# EasyEDA Pro project stopwatch.eprj, schematic Schematic1

## Sheets
1 mcu: Board Name: Board1; Create Date: 2025-03-25; Page Name: mcu; Project Name: stopwatch; Schematic Name: Schematic1; Update Date: 2025-05-22; Company: 嘉立创EDA; Page Size: A4; Version: V1.0
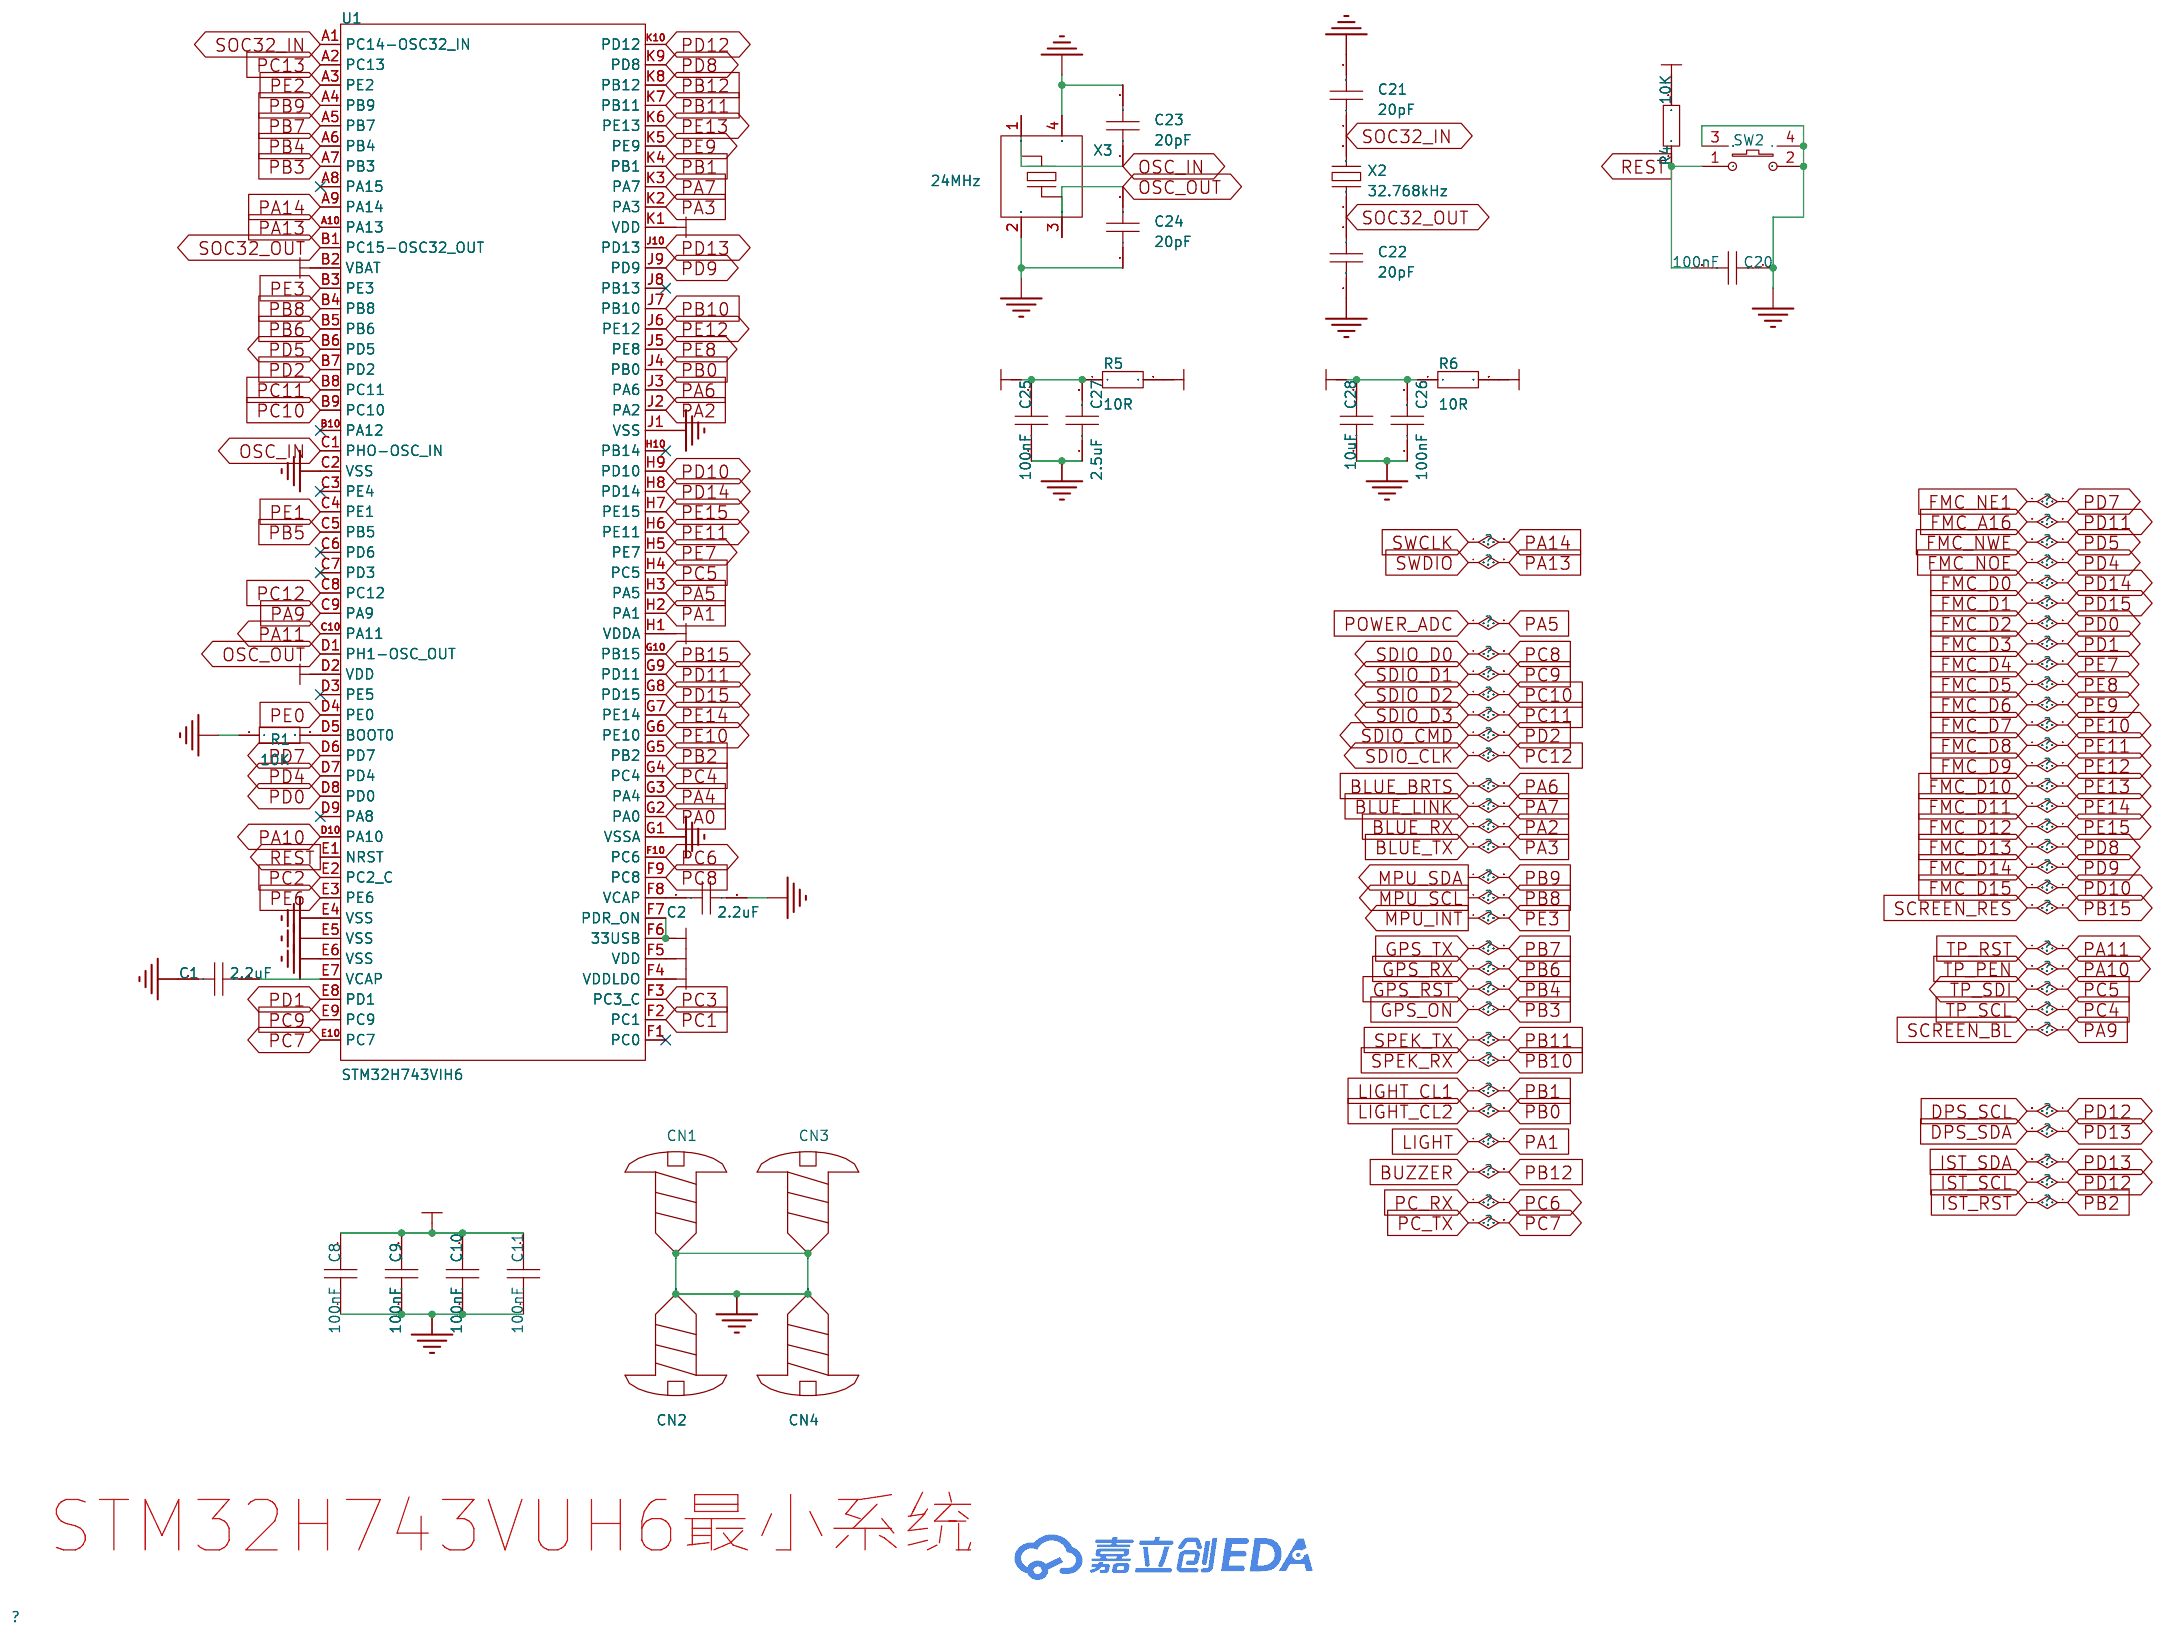
[diagram p0: mcu]
2 PERIPHERAL: Page Name: PERIPHERAL; Update Date: 2025-07-08; Page Size: A3
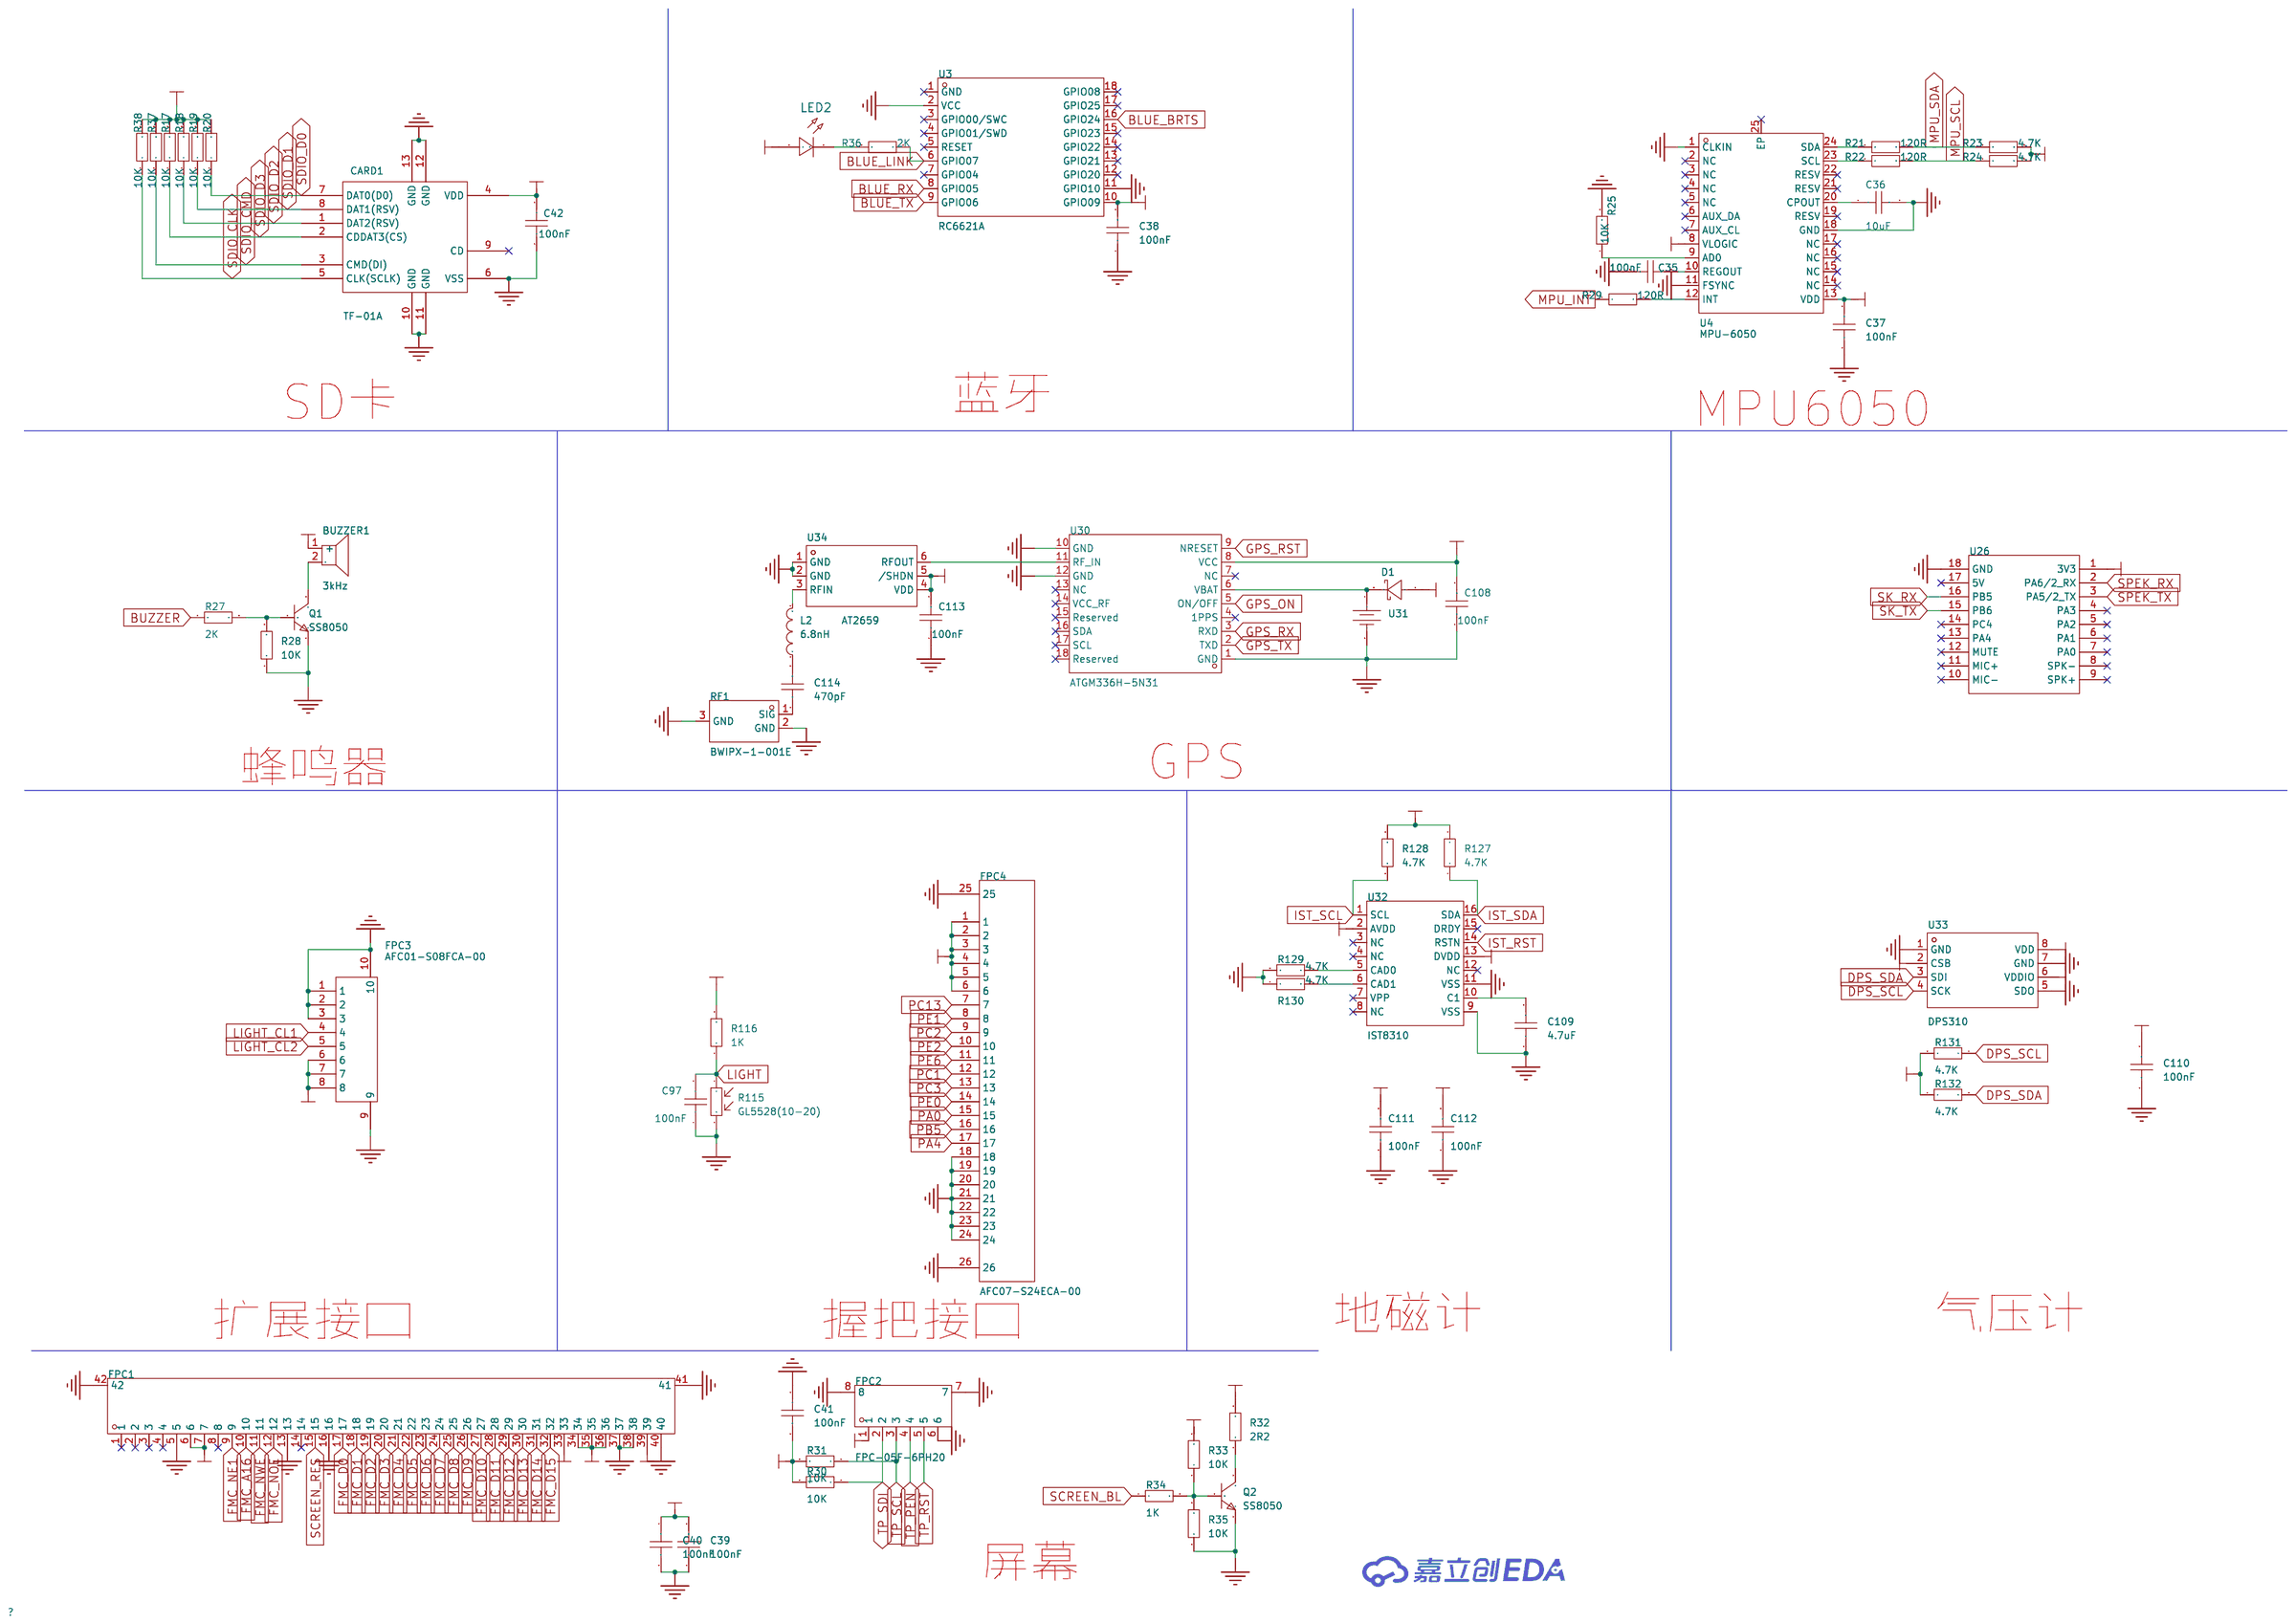
[diagram p1: PERIPHERAL]
3 power: Page Name: power; Update Date: 2025-07-08
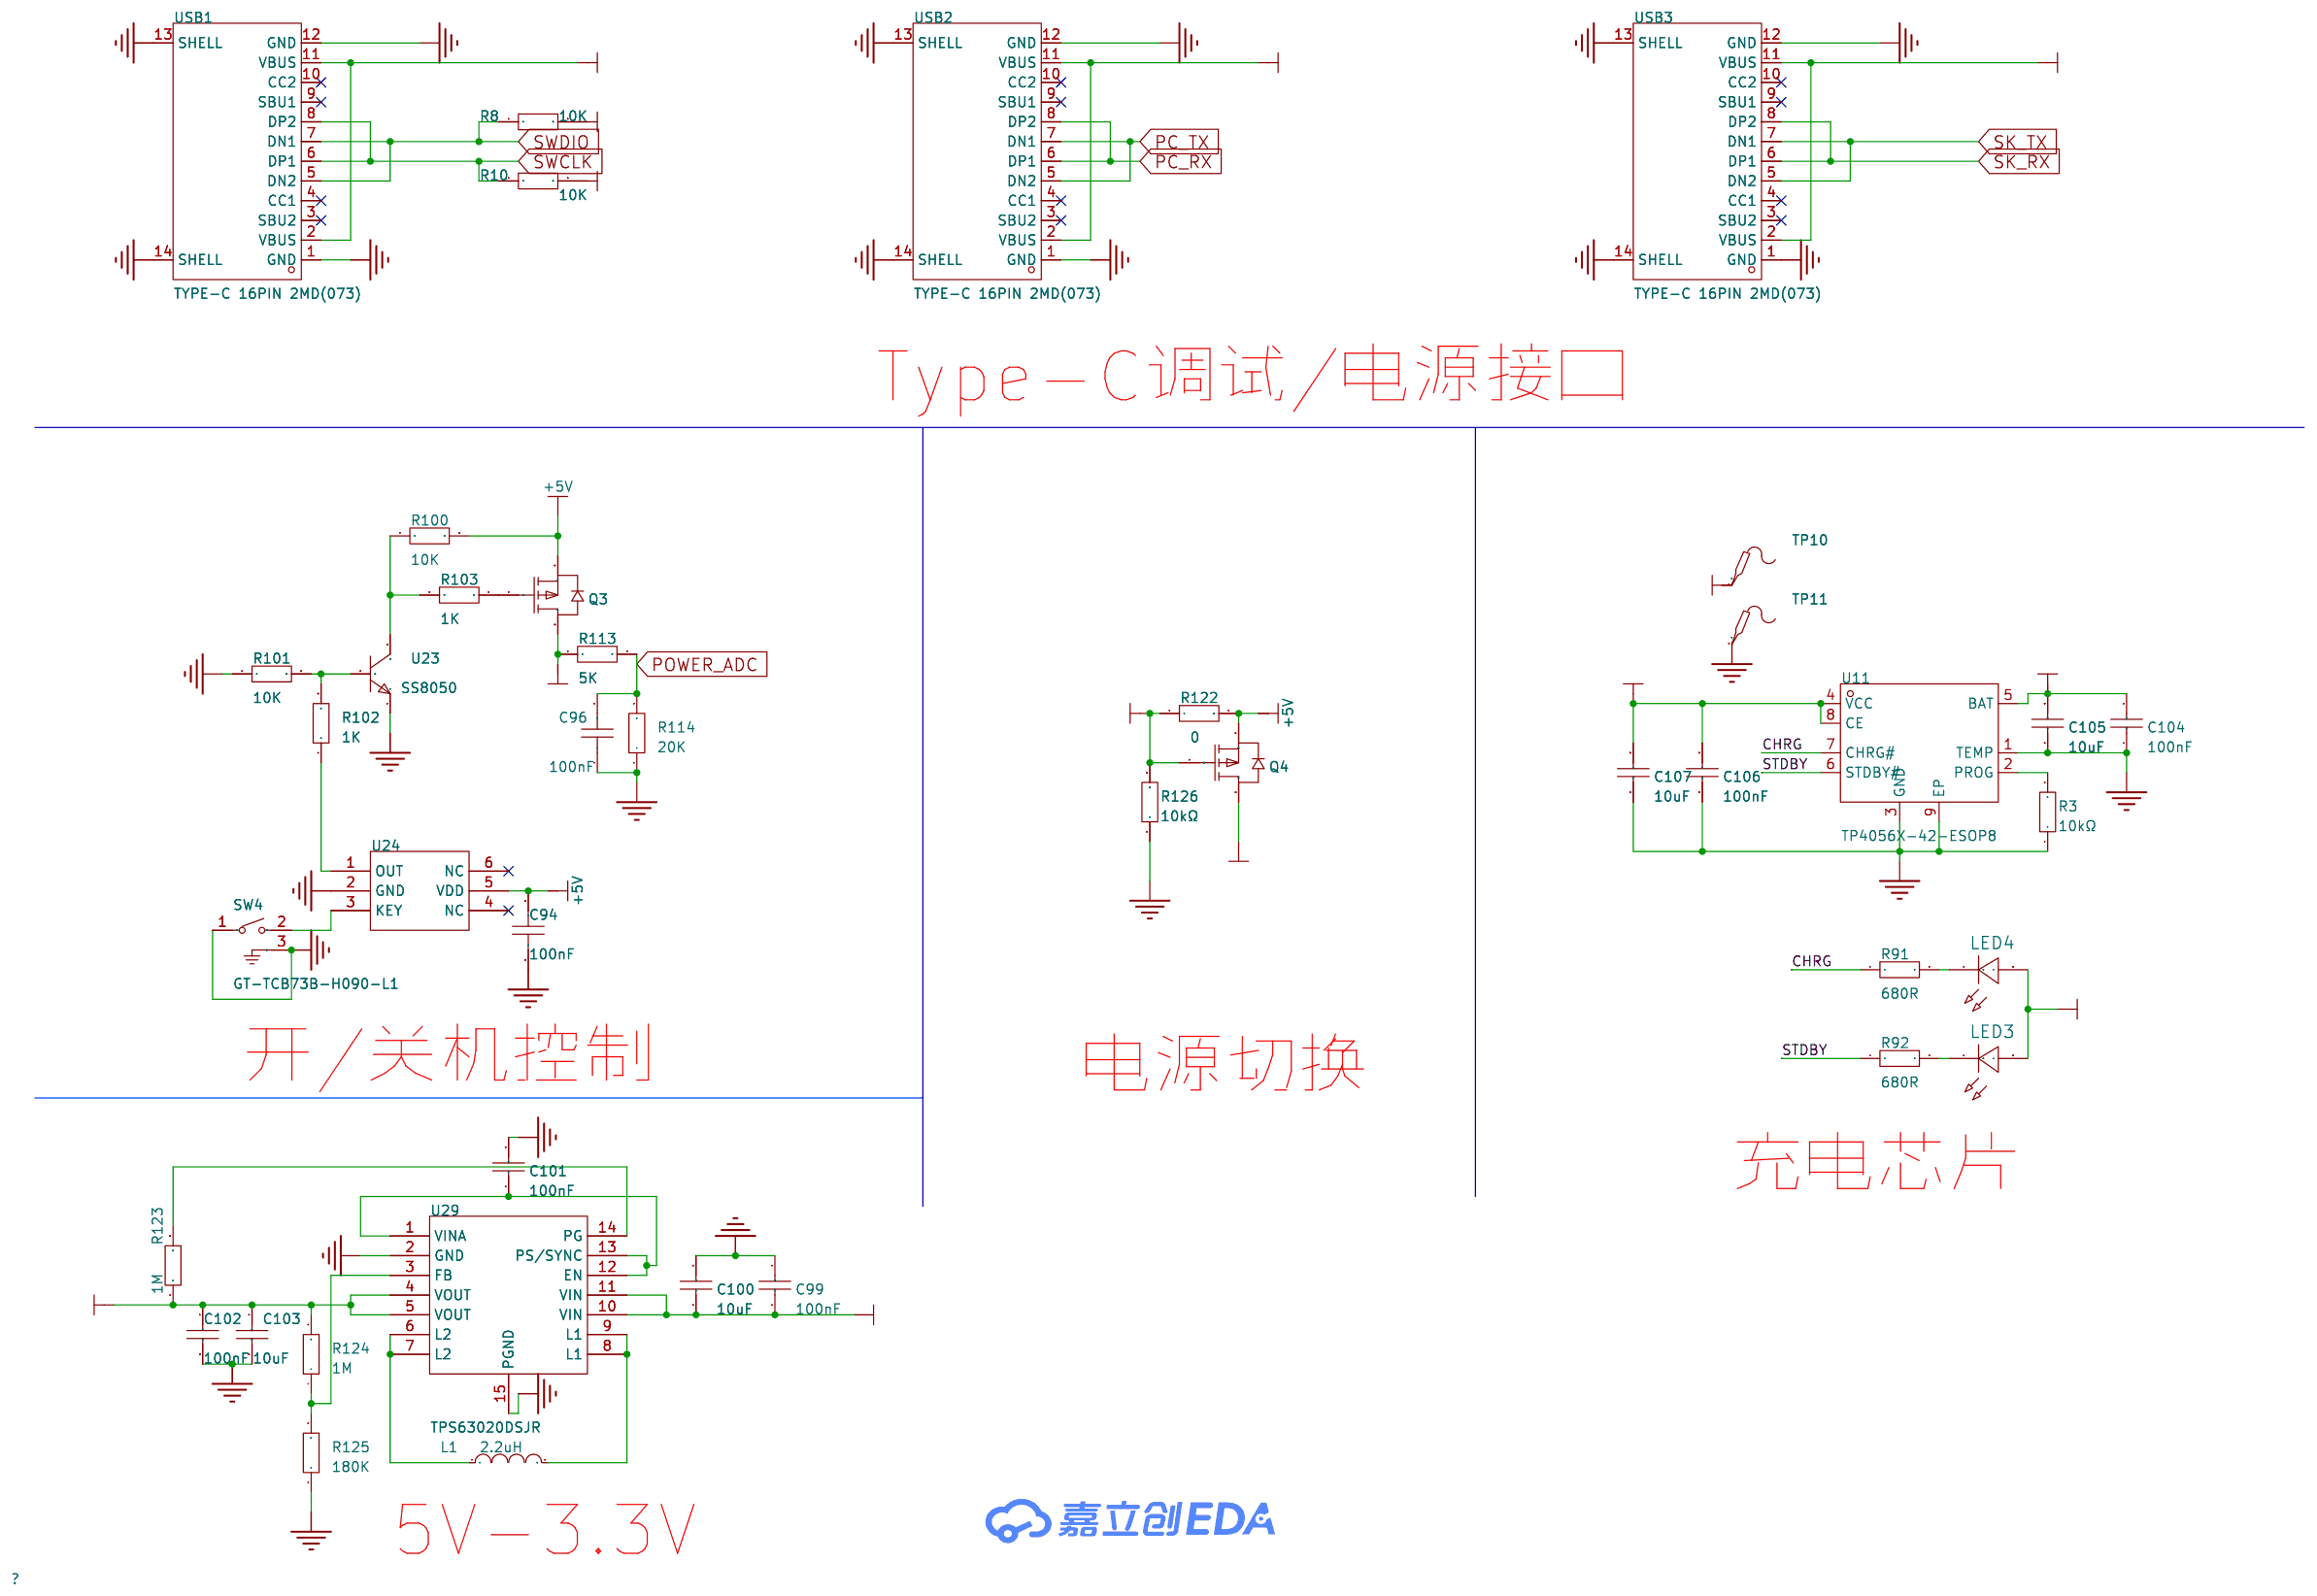
[diagram p2: power]

## Parts
sheet mcu
C1  2.2uF  [C0402]
C2  2.2uF  [C0402]
C8  100nF  [C0402]
C9  100nF  [C0402]
C10  100nF  [C0402]
C11  100nF  [C0402]
C20  100nF  [C0603]
C21  20pF  [C0402]
C22  20pF  [C0402]
C23  20pF  [C0402]
C24  20pF  [C0402]
C25  100nF  [C0402]
C26  100nF  [C0402]
C27  2.5uF  [C0402]
C28  10uF  [C0402]
CN1  SMTSOM330BTR  [M3-TH_BD6.0-D4.3]
CN2  SMTSOM330BTR  [M3-TH_BD6.0-D4.3]
CN3  SMTSOM330BTR  [M3-TH_BD6.0-D4.3]
CN4  SMTSOM330BTR  [M3-TH_BD6.0-D4.3]
R1  10K  [R0402]
R4  10K  [R0603]
R5  10R  [R0402]
R6  10R  [R0402]
SW2  TS24CA 250gf 013  [SW-SMD_L4.7-W3.5-P3.35-EH]
U1  STM32H743VIH6  [BGA-100_L8.0-W8.0-P0.80-R10-C10-BL]
X2  32.768kHz  [OSC-SMD_L3.2-W1.5]
X3  24MHz  [CRYSTAL-SMD_4P-L2.0-W1.6-BL-A]
sheet PERIPHERAL
BUZZER1  3kHz  [BUZ-TH_BD9.6-P5.00-D0.7-FD]
C35  100nF  [C0603]
C36  10uF  [C0603]
C37  100nF  [C0603]
C38  100nF  [C0603]
C39  100nF  [C0603]
C40  100nF  [C0603]
C41  100nF  [C0603]
C42  100nF  [C0603]
C97  100nF  [C0603]
C108  100nF  [C0603]
C109  4.7uF  [C0603]
C110  100nF  [C0603]
C111  100nF  [C0603]
C112  100nF  [C0603]
C113  100nF  [C0603]
C114  470pF  [C0603]
CARD1  TF-01A  [TF-SMD_TF-01A]
D1  B5819WS  [SOD-323_L1.7-W1.3-LS2.5-FD]
FPC1  AFC07-S40ECA-00  [FPC-SMD_P0.50-40P_LCS-SJ-H2.0]
FPC2  FPC-05F-6PH20  [FPC-SMD_6P-P0.50_XUNPU_FPC-05F-6PH20]
FPC3  AFC01-S08FCA-00  [FPC-SMD_P0.50-8P_FGS-XJ-H2.0]
FPC4  AFC07-S24ECA-00  [FPC-SMD_AFC07-S24ECA-00]
L2  6.8nH  [L0603]
LED2  -  [LED_0603]
Q1  SS8050  [SOT-23-3_L2.9-W1.3-P1.90-LS2.4-BR]
Q2  SS8050  [SOT-23-3_L2.9-W1.3-P1.90-LS2.4-BR]
R17  10K  [R0603]
R18  10K  [R0603]
R19  10K  [R0603]
R20  10K  [R0603]
R21  120R  [R0603]
R22  120R  [R0603]
R23  4.7K  [R0603]
R24  4.7K  [R0603]
R25  10K  [R0603]
R27  2K  [R0603]
R28  10K  [R0603]
R29  120R  [R0603]
R30  10K  [R0603]
R31  10K  [R0603]
R32  2R2  [R0603]
R33  10K  [R0603]
R34  1K  [R0603]
R35  10K  [R0603]
R36  2K  [R0603]
R37  10K  [R0603]
R38  10K  [R0603]
R115  GL5528(10-20)  [RES-TH_L5.1-W4.3-P3.40-D0.5]
R116  1K  [R0603]
R127  4.7K  [R0603]
R128  4.7K  [R0603]
R129  4.7K  [R0603]
R130  4.7K  [R0603]
R131  4.7K  [R0603]
R132  4.7K  [R0603]
RF1  BWIPX-1-001E  [IPEX-SMD_BWIPX-1-001E]
U3  RC6621A  [BULETM-SMD_18P-L15.2-W11.2-P1.27]
U4  MPU-6050  [QFN-24_L4.0-W4.0-P0.50-BL-EP2.7]
U26  -  [ASRPRO_CORE]
U30  ATGM336H-5N31  [GPSM-SMD_ATGM336H-TR]
U31  MS621FE-FL11E  [BAT-SMD_FL11E]
U32  IST8310  [LGA-16_L3.0-W3.0-P0.50-BL_SQ]
U33  DPS310  [LGA-8_DPS310XTSA1]
U34  AT2659  [DFN-6_L1.6-W1.0-P0.55-BL]
sheet power
C94  100nF  [C0603]
C96  100nF  [C0603]
C99  100nF  [C0603]
C100  10uF  [C0603]
C101  100nF  [C0603]
C102  100nF  [C0603]
C103  10uF  [C0603]
C104  100nF  [C0603]
C105  10uF  [C0603]
C106  100nF  [C0603]
C107  10uF  [C0603]
L1  2.2uH  [IND-SMD_L4.4-W4.2]
LED3  -  [LED_0603]
LED4  -  [LED_0603]
Q3  AO3401A  [SOT-23_L2.9-W1.3-P1.90-LS2.4-BR]
Q4  AO3401A  [SOT-23_L2.9-W1.3-P1.90-LS2.4-BR]
R3  10kΩ  [R0603]
R8  10K  [R0603]
R10  10K  [R0603]
R91  680R  [R0603]
R92  680R  [R0603]
R100  10K  [R0603]
R101  10K  [R0603]
R102  1K  [R0603]
R103  1K  [R0603]
R113  5K  [R0603]
R114  20K  [R0603]
R122  0  [R0603]
R123  1M  [R0603]
R124  1M  [R0603]
R125  180K  [R0603]
R126  10kΩ  [R0603]
SW4  GT-TCB73B-H090-L1  [SW-TH_G-SWITCH_GT-TCB73B-H090-L1]
TP10  -  [Test-Point-0.5mm]
TP11  -  [Test-Point-0.5mm]
U11  TP4056X-42-ESOP8  [SOP-8_L4.9-W3.9-P1.27-LS6.0-TL-EP]
U23  SS8050  [SOT-23-3_L2.9-W1.3-P1.90-LS2.4-BR]
U24  -  [SOT-23-6_L2.9-W1.6-P0.95-LS2.7-BR]
U29  TPS63020DSJR  [VSON-14_L4.0-W3.0-P0.50-BL-EP_TI_DSJ]
USB1  TYPE-C 16PIN 2MD(073)  [USB-C-SMD_TYPE-C-6PIN-2MD-073]
USB2  TYPE-C 16PIN 2MD(073)  [USB-C-SMD_TYPE-C-6PIN-2MD-073]
USB3  TYPE-C 16PIN 2MD(073)  [USB-C-SMD_TYPE-C-6PIN-2MD-073]

## Library data of the parts
C1 C2 C8-C11 C21-C28 = CAP_0402: Supplier Footprint: 0402
C20 C35-C42 C94 C96 C97 C108-C114 = CAP_0603: Supplier Footprint: 0603
CN1-CN4 = SMTSOM330BTR: LCSC Part Name: YIYUAN(怡远) 电路板表贴圆螺母柱PCB贴片连接器 M3X3 铜镀锡; Supplier Part: C5221843; Manufacturer: YIYUAN(怡远); Supplier Footprint: SMD; JLCPCB Part Class: 扩展库; Datasheet: https://atta.szlcsc.com/upload/public/pdf/source/20230202/A42D22DA7D93D728E13784C4003E4077.pdf; Supplier: LCSC; specifications: M3; surface treatment: 镀锡; material quality: 铜
R1 R5 R6 = Res_0402: Supplier Footprint: 0402
R4 R8 R10 R17-R25 R27-R38 R91 R92 R100-R103 R113 R114 R116 R122-R125 R127-R132 = Res_0603: Supplier Footprint: 0603
SW2 = TS24CA 250gf 013: 电路结构:单刀单掷;按钮形状:矩形按钮;作用力:250gf;安装方式:卧贴;开关长度:4.55mm;开关宽度:1.8mm;开关高度:3.5mm;带支架:不带;触点电流:50mA;额定电压(AC):-;额定电压(DC):12V;额定功率:0.6W;绝缘电阻:100MΩ;带灯:无;机械寿命:3万次;; LCSC Part Name: 2*4*3.5mm半包小贝贝TS-018小侧按键m165蓝牙耳机开关 250gf; Supplier Part: C5373430; Manufacturer: SHOU HAN(首韩); Supplier Footprint: SMD; JLCPCB Part Class: 扩展库; Datasheet: https://atta.szlcsc.com/upload/public/pdf/source/20230321/913029B0FB0CD391AF5EFD51697D8EC4.pdf; Supplier: LCSC; Circuit: 单刀单掷; Actuator Style: 矩形按钮; Operating Force: 250gf; Mounting Style: 卧贴; Switch Length: 4.55mm; Switch Width: 1.8mm; Switch Height: 3.5mm; Strike Gundam: 不带; Contact Current: 50mA; Voltage Rating (DC): 12V; Power Rating: 0.6W; Insulation Resistance: 100MΩ; Actuator/Cap Color: 黑色; With Lamp: 无; Mechanical Life: 3万次; Operating Temperature: -40℃~+85℃
U1 = STM32H743VIH6: LCSC Part Name: 带DSP和DP-FPU的高性能ARM Cortex-M7 MCU，具有2 MB Flash、1 MB RAM、480 MHz CPU、ART加速器、一级缓存、外部存储器接口和大量外设; Supplier Part: C964146; Manufacturer: ST(意法半导体); Supplier Footprint: TFBGA-100; JLCPCB Part Class: Extended Part; Datasheet: https://atta.szlcsc.com/upload/public/pdf/source/20220307/46489B78091107FB73FE6602EFA9948C.pdf; Supplier: LCSC
X2 = X321532768KGD2SI: 晶振类型:贴片晶振;频率:32.768kHz;常温频差:±20ppm;外接负载电容:12.5pF;频率稳定度(全温):-;; LCSC Part Name: 32.768kHz ±20ppm 12.5pF; Supplier Part: C620155; Manufacturer: YXC(扬兴晶振); Supplier Footprint: SMD3215-2P; JLCPCB Part Class: 扩展库; Datasheet: https://atta.szlcsc.com/upload/public/pdf/source/20240329/3A7650FD985DD0DE85694D3785AB4916.pdf; Supplier: LCSC; Crystal Type: 贴片晶振; Normal temperature Frequency Tolerance: ±20ppm; External load capacitor: 12.5pF; Operating Temperature: -40℃~+85℃
X3 = XL7EL89CKI-111YLC-24M: LCSC Part Name: 24MHz ±10ppm 8pF; Supplier Part: C2965580; Manufacturer: YXC(扬兴晶振); Supplier Footprint: SMD2016-4P; JLCPCB Part Class: 扩展库; Datasheet: https://atta.szlcsc.com/upload/public/pdf/source/20240329/C26C9A15A73CBCFBF373B30A8E126750.pdf; Supplier: LCSC; Type: 贴片晶振; Normal temperature Frequency Tolerance: ±10ppm; Load Capacitance: 8pF; Frequency Stability: ±20ppm; Operating Temperature: -40℃~+85℃
BUZZER1 = HNB09A05: Supplier Part: C96493; Manufacturer: 华能; Supplier Footprint: 插件,D=9mm; JLCPCB Part Class: Extended Part; Datasheet: https://atta.szlcsc.com/upload/public/pdf/source/20241128/E20AB0BE5F95571B8A04E10305734657.pdf; Supplier: LCSC; Driver Circuitry: 有源(内含驱动线路); Technology: 电磁式; Voltage - Supply: 4V~8V; Sound Pressure Level(SPL): 85dB; Diameter(φD): 9mm; Height: 5.7mm
CARD1 = TF-01A_C91145: 卡连接方式:自弹式;卡类型:MicroSD卡(TF卡);连接器类型:卡座;本体最大高度:1.85mm;工作温度范围:-;; LCSC Part Name: 自弹式 MicroSD卡(TF卡) 卡座; Supplier Part: C91145; Manufacturer: 韩国韩荣; Supplier Footprint: SMD; JLCPCB Part Class: 扩展库; Datasheet: https://atta.szlcsc.com/upload/public/pdf/source/20190322/C91145_63CBD6FB4639A3A3EC6A9721F18AE0FB.pdf; Supplier: LCSC; Card Connection Mode: 自弹式; Card Type: MicroSD卡(TF卡); Connector Type: 卡座; Supplementary Features: 带定位柱; Maximum Body Height: 1.85mm
D1 = B5819WS_C7420331: LCSC Part Name: 电压:40V 电流:1A; Supplier Part: C7420331; Manufacturer: 宏迦橙; Supplier Footprint: SOD-323; JLCPCB Part Class: 扩展库; Datasheet: https://atta.szlcsc.com/upload/public/pdf/source/20230828/03CA0F4F90DAE368A7153B7B5E4D0651.pdf; Supplier: LCSC; Diode Configuration: 独立式; Forward Voltage (Vf@If): 600mV@1.0A; Reverse Voltage (Vr): 40V; Rectified Current: 1A; Reverse Leakage Current (Ir): 1mA@40V
FPC1 = AFC07-S40ECA-00: 锁定特性:抽屉式;触点类型:上接;触点数量:40P;间距:0.5mm;安装类型:卧贴;; LCSC Part Name: 间距:0.5mm P数:40P 抽屉式 上接; Supplier Part: C262648; Manufacturer: JS(钜硕电子); Supplier Footprint: SMD,P=0.5mm,卧贴; JLCPCB Part Class: 扩展库; Datasheet: https://atta.szlcsc.com/upload/public/pdf/source/20190726/C11082_A2E7B12387019CE4314BB5199EE0FDF4.pdf; Supplier: LCSC; Locking Feature: 抽屉式; Contact Type: 上接; Number of Contacts: 40P; Pitch: 0.5mm; Mounting Type: 卧贴; FFC, FCB Thickness: 0.3mm; Height Above Board: 2mm
FPC2 = FPC-05F-6PH20: 锁定特性:翻盖式;触点类型:下接;触点数量:6P;间距:0.5mm;安装类型:卧贴;工作温度范围:-25℃~+85℃;; LCSC Part Name: 间距:0.5mm P数:6P 翻盖式 下接; Supplier Part: C2856796; Manufacturer: XUNPU(讯普); Supplier Footprint: SMD,P=0.5mm,卧贴; JLCPCB Part Class: 扩展库; Datasheet: https://atta.szlcsc.com/upload/public/pdf/source/20210922/16B003FB53336DDF6538142CC465AC4D.pdf; Supplier: LCSC; Locking Feature: 翻盖式; Contact Type: 下接; Number of Contacts: 6P; Pitch: 0.5mm; Mounting Type: 卧贴; FFC, FCB Thickness: 0.3mm; Height Above Board: 2mm; Operating Temperature Range: -25℃~+85℃
FPC3 = AFC01-S08FCA-00: 锁定特性:翻盖式;触点类型:下接;触点数量:8P;间距:0.5mm;安装类型:卧贴;; LCSC Part Name: 间距:0.5mm P数:8P 翻盖式 下接; Supplier Part: C262657; Manufacturer: JS(钜硕电子); Supplier Footprint: SMD,P=0.5mm,卧贴; JLCPCB Part Class: 扩展库; Datasheet: https://atta.szlcsc.com/upload/public/pdf/source/20190816/C413942_2A72D1AC756EAE17EEDF756A339D4500.pdf; Supplier: LCSC; Locking Feature: 翻盖式; Contact Type: 下接; Number of Contacts: 8P; Pitch: 0.5mm; Mounting Type: 卧贴; FFC, FCB Thickness: 0.3mm; Height Above Board: 2mm
FPC4 = AFC07-S24ECA-00: LCSC Part Name: 间距:0.5mm P数:24P 抽屉式 上接; Supplier Part: C262643; Manufacturer: JS(钜硕电子); Supplier Footprint: SMD,P=0.5mm,卧贴; JLCPCB Part Class: 扩展库; Datasheet: https://atta.szlcsc.com/upload/public/pdf/source/20190726/C11082_A2E7B12387019CE4314BB5199EE0FDF4.pdf; Supplier: LCSC; Locking Feature: 抽屉式; Contact Type: 上接; Number of Contacts: 24P; Pitch: 0.5mm; Mounting Type: 卧贴; FFC, FCB Thickness: 0.3mm; Height Above Board: 2mm
L2 = LQW18AN6N8C00D: Supplier Part: C86136; Manufacturer: muRata(村田); Supplier Footprint: 0603; JLCPCB Part Class: 扩展库; Datasheet: https://atta.szlcsc.com/upload/public/pdf/source/20180326/C86136_7D4C2B2C0A8359F5C7679A70DBFFC85D.pdf; Supplier: LCSC; Rated Current: 750mA; DC Resistance (DCR): 82mΩ
LED2-LED4 = LED_0603-R: Supplier Footprint: 0603
Q1 Q2 = SS8050_C916392: 晶体管类型:NPN;集电极电流(Ic):1.5A;集射极击穿电压(Vceo):25V;功率(Pd):300mW;直流电流增益(hFE@Ic,Vce):-;; LCSC Part Name: NPN 电流:1.5A 耐压:25V; Supplier Part: C916392; Manufacturer: JSMSEMI(杰盛微); Supplier Footprint: SOT-23; JLCPCB Part Class: 扩展库; Datasheet: https://atta.szlcsc.com/upload/public/pdf/source/20230807/CAABCAAF77D43CB838E37CFA5C9BFE5C.pdf; Supplier: LCSC; Transistor Type: NPN; Collector Current (Ic): 1.5A; Collector-Emitter Breakdown Voltage (Vceo): 25V; Power Dissipation (Pd): 300mW; Collector Cut-Off Current (Icbo): 100nA; Collector-Emitter Saturation Voltage (VCE(sat)@Ic,Ib): 500mV@800mA,80mA; Operating Temperature: -55℃~+150℃
R115 = GL5528(10-20)_C10081: 暗电阻:1MΩ;亮电阻 @ 10Lux:10kΩ~20kΩ;光谱峰值(波长):540nm;; LCSC Part Name: 亮电阻:10kΩ~20kΩ 暗电阻:1MΩ; Supplier Part: C10081; Manufacturer: JCHL(晶创和立); Supplier Footprint: 插件,P=3.4mm; JLCPCB Part Class: 扩展库; Datasheet: https://atta.szlcsc.com/upload/public/pdf/source/20200417/C515010_C10502EF7F431E893A7F20DB83F527F0.pdf; Supplier: LCSC; Dark Resistance: 1MΩ; Illuminated Resistance @ 10Lux: 10kΩ~20kΩ; Applied Voltage: 150V; Spectral Peak: 540nm
RF1 = BWIPX-1-001E: 连接器类型:板端;接口类型:内针;端口数量:1;接口直径:-;接口长度/高度:-;频率-最大值:6GHz;射频系列:IPEX;阻抗:50Ω;样式:-;工作温度范围:-;; LCSC Part Name: IPEX 内针; Supplier Part: C496552; Manufacturer: BAT WIRELESS(蝙蝠无线); Supplier Footprint: SMD; JLCPCB Part Class: 扩展库; Datasheet: https://atta.szlcsc.com/upload/public/pdf/source/20201223/C496552_05E5A9956EAE1A8819C5051D085B1DED.pdf; Supplier: LCSC; Connector Type: 板端; Interface Type: 内针; Number of Ports: 1; Frequency-Max: 6GHz; RF Series: IPEX; Impedance: 50Ω
U3 = RC6621A: 核心芯片:HS6621A芯片;支持接口:UART;最大发射功率:6dBm;通讯距离:20m~100m;接收灵敏度:-94dBm;; LCSC Part Name: 蓝牙5.2 BLE透传模块; Supplier Part: C2886280; Manufacturer: RF Crazy(智汉); Supplier Footprint: SMD,11x15mm; JLCPCB Part Class: 扩展库; Datasheet: https://atta.szlcsc.com/upload/public/pdf/source/20230407/49E21971C810D795DE5D434EE457DEDA.pdf; Supplier: LCSC; Core  IC: HS6621A芯片; Support Interface: UART; Output Power  (Max): 6dBm; Operating Voltage: 2V~3.6V; Receive  Current: 3.8mA; Send  Current: 8mA; Communication Distance: 20m~100m; Sensitivity: -94dBm; Operating Temperature: -30℃~+85℃
U4 = MPU-6050: 传感器类型:加速度计陀螺仪;; Supplier Part: C24112; Manufacturer: TDK InvenSense(应美盛); Supplier Footprint: QFN-24-EP(4x4); JLCPCB Part Class: 扩展库; Datasheet: https://atta.szlcsc.com/upload/public/pdf/source/20140425/1457707046159.pdf; Supplier: LCSC; Sensor Type: 加速度计陀螺仪; Operating Temperature: -40℃~+85℃
U26 = ASRPRO_CORE
U30 = ATGM336H-5N31: 卫星定位模块 GPS+BDS; LCSC Part Name: BDS/GNSS 全星座定位导航模块; Supplier Part: C90770; Manufacturer: 杭州中科微; Supplier Footprint: SMD,9.7x10.1mm; JLCPCB Part Class: 扩展库; Datasheet: https://atta.szlcsc.com/upload/public/pdf/source/20161226/1482720799860.pdf; Supplier: LCSC
U31 = MS621FE-FL11E: FL11E 3.3V可充电纽扣电池 5.5mAH; LCSC Part Name: Seiko/精工，可充电纽扣电池，3V，MS621FE-FL11E，1个; Supplier Part: C80909; Manufacturer: Seiko(精工); JLCPCB Part Class: 扩展库; Datasheet: https://atta.szlcsc.com/upload/public/pdf/source/20230719/88F2811CC6B30DD05F1C5A5953BF9E77.pdf; Supplier: LCSC; voltage: 3 V; capacity: 5.5mAh; chemical composition: 锂离子; temperature range: -20-60°C; type: 纽扣; characteristic: 可充电; Packaging quantity: 1; Battery capacity: -；-；-
U32 = IST8310_C2683055: Supplier Part: C2683055; Manufacturer: iSentek(爱盛科技); Supplier Footprint: LGA-16(3x3); JLCPCB Part Class: 扩展库; Datasheet: https://atta.szlcsc.com/upload/public/pdf/source/20250224/70FB1E25A3B1BEF4BDD1315496E152E4.pdf; Supplier: LCSC
U33 = DPS310: LCSC Part Name: DPS310 停产; Supplier Part: C130156; Manufacturer: Infineon(英飞凌); Supplier Footprint: LGA-8(2x2.5); JLCPCB Part Class: 扩展库; Datasheet: https://atta.szlcsc.com/upload/public/pdf/source/20170919/C130156_1505787189817976894.pdf; Supplier: LCSC
U34 = AT2659: LCSC Part Name: L1频段卫星导航射频前端低噪声放大器芯片; Supplier Part: C92450; Manufacturer: 杭州中科微; Supplier Footprint: DFN-6(1x1.6); JLCPCB Part Class: 扩展库; Datasheet: https://atta.szlcsc.com/upload/public/pdf/source/20170105/1483610792788.pdf; Supplier: LCSC; Supply Voltage: 1.4V~3.6V; Gain: 21.5dB; P1dB: -14dBm; Noise Figure: 0.8dB
C99 C101 C102 C104 C106 = CC0603KRX7R9BB104: 容值:100nF;精度:±10%;额定电压:50V;材质(温度系数):X7R;; LCSC Part Name: 100nF ±10% 50V; Supplier Part: C14663; Manufacturer: YAGEO(国巨); Supplier Footprint: 0603; JLCPCB Part Class: Basic Part; Datasheet: https://atta.szlcsc.com/upload/public/pdf/source/20180910/C282072_33301C7F631E79921B82A8DAC6BCC5B3.pdf; Supplier: LCSC; Tolerance: ±10%; Voltage Rated: 50V; Temperature Coefficient: X7R
C100 C103 C105 C107 = CL10A106MA8NRNC: 容值:10uF;精度:±20%;额定电压:25V;材质(温度系数):X5R;; LCSC Part Name: 10uF ±20% 25V; Supplier Part: C96446; Manufacturer: SAMSUNG(三星); Supplier Footprint: 0603; JLCPCB Part Class: 基础库; Datasheet: https://atta.szlcsc.com/upload/public/pdf/source/20170325/1490427913016.pdf; Supplier: LCSC; Tolerance: ±20%; Voltage Rated: 25V; Temperature Coefficient: X5R
L1 = FXL0420-4R7-M: 电感值:4.7uH;精度:±20%;额定电流:2.8A;饱和电流(Isat):3A;类型:一体成型电感;; LCSC Part Name: 4.7uH ±20% 3A; Supplier Part: C167208; Manufacturer: cjiang(长江微电); Supplier Footprint: SMD,4.2x4.4mm; JLCPCB Part Class: 扩展库; Datasheet: https://atta.szlcsc.com/upload/public/pdf/source/20240426/3189EA8206330E2108542F9E34E540E7.pdf; Supplier: LCSC; Tolerance: ±20%; Rated Current: 2.8A; Saturation Current (Isat): 3A; DC Resistance (DCR): 105mΩ; Type: 一体成型电感
Q3 Q4 = AO3401A_C15127: 类型:P沟道;漏源电压(Vdss):30V;连续漏极电流(Id):4A;功率(Pd):1.4W;导通电阻(RDS(on)@Vgs,Id):44mΩ@10V,4.3A;; LCSC Part Name: P沟道30V4A; Supplier Part: C15127; Manufacturer: AOS; Supplier Footprint: SOT-23-3L; JLCPCB Part Class: BasicPart; Datasheet: https://atta.szlcsc.com/upload/public/pdf/source/20160507/1462613609053.pdf; Supplier: LCSC; Type: P沟道; Drain Source Voltage (Vdss): 30V; Continuous Drain Current (Id): 4A; Power Dissipation (Pd): 1.4W; Drain Source On Resistance (RDS(on)@Vgs,Id): 44mΩ@10V,4.3A; Gate Threshold Voltage (Vgs(th)@Id): 1.3V@250uA
R3 R126 = 0603WAF1002T5E: 电阻类型:厚膜电阻;阻值:10kΩ;精度:±1%;功率:100mW;; LCSC Part Name: 厚膜电阻 10kΩ ±1% 100mW; Supplier Part: C25804; Manufacturer: UNI-ROYAL(厚声); Supplier Footprint: 0603; JLCPCB Part Class: 基础库; Datasheet: https://atta.szlcsc.com/upload/public/pdf/source/20200306/C422600_1E6D84923E4A46A82E41ADD87F860B5C.pdf; Supplier: LCSC; Type: 厚膜电阻; Tolerance: ±1%; Power(Watts): 100mW; Temperature Coefficient: ±100ppm/℃; Overload Voltage (Max): 75V; Operating Temperature Range: -55℃~+155℃
SW4 = GT-TCB73B-H090-L1: LCSC Part Name: 4.5*4.5*9mm 卧插 轻触开关; Supplier Part: C2890355; Manufacturer: G-Switch(品赞); Supplier Footprint: 插件; JLCPCB Part Class: 扩展库; Datasheet: https://atta.szlcsc.com/upload/public/pdf/source/20211129/A9DBC36F7854845B7C58D6A3B2089FE3.pdf; Supplier: LCSC; Circuit: 单刀单掷; Actuator Style: 圆形按钮; Operating Force: 2.5N; Mounting Style: 卧插; Switch Length: 4.5mm; Switch Width: 4.5mm; Switch Height: 9mm; Strike Gundam: 不带; Contact Current: 50mA; Voltage Rating (DC): 12V; Insulation Resistance: 100MΩ; Actuator/Cap Color: 黑色; With Lamp: 无; Pin Style: PC引脚; Mechanical Life: 10万次; Operating Temperature: -30℃~+85℃
TP10 TP11 = Test-Point: Test Point 测试点
U11 = TP4056X-42-ESOP8: Supplier Part: C2763448; Manufacturer: TOPPOWER(南京拓微); Supplier Footprint: SOP-8-EP-150mil; JLCPCB Part Class: 扩展库; Datasheet: https://atta.szlcsc.com/upload/public/pdf/source/20221111/3D7D53D5011BF4ED4C4D0D9BFDBB1404.pdf; Supplier: LCSC
U23 = SS8050_C7420370: 晶体管类型:NPN;集电极电流(Ic):1.5A;集射极击穿电压(Vceo):25V;功率(Pd):300mW;直流电流增益(hFE@Ic,Vce):120@100mA,1.0V;; LCSC Part Name: 耐压:25V 电流:1.5A NPN H档 200-350; Supplier Part: C7420370; Manufacturer: 宏迦橙; Supplier Footprint: SOT-23; JLCPCB Part Class: Extended Part; Datasheet: https://atta.szlcsc.com/upload/public/pdf/source/20231222/9C4050A7669EB24B3ACD0418218817FD.pdf; Supplier: LCSC; Transistor Type: NPN; Collector Current (Ic): 1.5A; Collector-Emitter Breakdown Voltage (Vceo): 25V; Power Dissipation (Pd): 300mW; DC Current Gain (hFE@Ic,Vce): 120@100mA,1.0V; Transition Frequency (fT): 100MHz; Collector Cut-Off Current (Icbo): 100nA; Collector-Emitter Saturation Voltage (VCE(sat)@Ic,Ib): 500mV@800mA,80mA; Operating Temperature: -55℃~+150℃
U24 = EC190708
U29 = TPS63020DSJR: 功能类型:升降压型;输出类型:可调;输入电压:1.8V~5.5V;输出电压:1.2V~5.5V;输出电流(最大值):3.5A;; Supplier Part: C15483; Manufacturer: TI(德州仪器); Supplier Footprint: VSON-14-EP(3x4); JLCPCB Part Class: 扩展库; Datasheet: https://www.ti.com/cn/lit/gpn/tps63020; Supplier: LCSC; Function: 升降压型; Output Type: 可调; Input Voltage: 1.8V~5.5V; Output Voltage: 1.2V~5.5V; Output Current (Max): 3.5A; Switching Frequency: 2.4MHz; Operating Temperature: -40℃~+85℃@(TA); Synchronous Rectification: 是; Number of Outputs: 1; Topology: 降压-升压式; Switch tube (built-in/external): 内置
USB1-USB3 = TYPE-C 16PIN 2MD(073): 连接器类型:Type-C;标准:USB 3.1;公母:母;安装方式:卧贴;触点数量:16P;端口数量:1;额定电流 - 电源:5A;工作温度范围:-25℃~+85℃;; LCSC Part Name: Type-C 母 卧贴; Supplier Part: C2765186; Manufacturer: SHOU HAN(首韩); Supplier Footprint: SMD; JLCPCB Part Class: 扩展库; Datasheet: https://atta.szlcsc.com/upload/public/pdf/source/20211123/39B17C16241EAC15C5E277BDA434118E.pdf; Supplier: LCSC; Connector Type: Type-C; Standard: USB 3.1; Gender: 母; Mounting Style: 卧贴; Number of Contacts: 16P; Number of Ports: 1; Current Rating - Power (Max): 5A; Operating Temperature Range: -25℃~+85℃; Rated Voltage (Max): 5V; Connect-Disconnect Life: 5千次; Core Colour: 黑色

## Nets
5V: C99.1 C100.1 D1.1(A) FPC3.6 FPC3.7 FPC3.8 Q3.3(D) R113.1 U29.10(VIN) U29.11(VIN)
+5V: C94.2 Q3.2(S) Q4.2(S) R100.2 R122.2 U24.5(VDD)
GND: C1.1 C2.2 C8.1 C9.1 C10.1 C11.1 C20.1 C21.2 C22.1 C23.2 C24.1 C25.1 C26.1 C27.1 C28.1 C35.1 C36.2 C37.1 C38.1 C39.1 C40.2 C41.1 C42.1 C94.1 C96.1 C97.1 C99.2 C100.2 C101.2 C102.2 C103.2 C104.1 C105.1 C106.1 C107.1 C108.1 C109.1 C110.1 C111.1 C112.1 C113.1 CARD1.6(VSS) CARD1.10(GND) CARD1.11(GND) CARD1.12(GND) CARD1.13(GND) CN1.1 CN2.1 CN3.1 CN4.1 FPC1.5 FPC1.13 FPC1.16 FPC1.37 FPC1.38 FPC1.40 FPC1.41 FPC1.42 FPC2.6 FPC2.7 FPC2.8 FPC3.1 FPC3.2 FPC3.3 FPC3.9 FPC3.10 FPC4.18 FPC4.19 FPC4.20 FPC4.21 FPC4.22 FPC4.23 FPC4.24 FPC4.25 FPC4.26 Q1.2(E) Q2.2(E) R1.1 R3.1 R25.2 R28.1 R35.1 R101.1 R114.1 R115.2 R125.1 R126.1 R129.2 R130.1 RF1.2(GND) RF1.3(GND) SW2.2 SW2.3 SW2.4 SW4.1 SW4.3 TP11.1 U1.C2(VSS) U1.E4(VSS) U1.E5(VSS) U1.E6(VSS) U1.G1(VSSA) U1.J1(VSS) U3.2(VCC) U3.11(GPIO10) U4.1(CLKIN) U4.11(FSYNC) U4.18(GND) U11.1(TEMP) U11.3(GND) U11.9(EP) U23.2(E) U24.2(GND) U26.18(GND) U29.2(GND) U29.15(PGND) U30.1(GND) U30.10(GND) U30.12(GND) U31.2(-) U32.9(VSS) U32.11(VSS) U33.1(GND) U33.5(SDO) U33.7(GND) U34.1(GND) U34.2(GND) USB1.1(GND) USB1.12(GND) USB1.13(SHELL) USB1.14(SHELL) USB2.1(GND) USB2.12(GND) USB2.13(SHELL) USB2.14(SHELL) USB3.1(GND) USB3.12(GND) USB3.13(SHELL) USB3.14(SHELL) X3.2(GND) X3.4(GND)
VBAT: C104.2 C105.2 Q4.3(D) TP10.1 U11.5(BAT)
VBUS: C106.2 C107.2 LED3.2(A) LED4.2(A) Q4.1(G) R122.1 R126.2 U11.4(VCC) U11.8(CE) USB1.2(VBUS) USB1.11(VBUS) USB2.2(VBUS) USB2.11(VBUS) USB3.2(VBUS) USB3.11(VBUS)
VCC3V3: BUZZER1.1(+) C8.2 C9.2 C10.2 C11.2 C37.2 C38.2 C39.2 C40.1 C41.2 C42.2 C102.1 C103.1 C108.2 C110.2 C111.2 C112.2 C113.2 CARD1.4(VDD) FPC1.6 FPC1.7 FPC1.33 FPC1.39 FPC2.1 FPC4.1 FPC4.2 FPC4.3 FPC4.4 FPC4.5 FPC4.6 LED2.2(A) R4.2 R6.2 R8.2 R10.2 R17.2 R18.2 R19.2 R20.2 R23.2 R24.2 R30.2 R31.2 R33.2 R37.2 R38.2 R116.2 R123.1 R124.2 R127.2 R128.1 R131.2 R132.1 U1.B2(VBAT) U1.D2(VDD) U1.F5(VDD) U1.F6(33USB) U1.F7(PDR_ON) U1.K1(VDD) U3.10(GPIO09) U4.8(VLOGIC) U4.13(VDD) U26.1(3V3) U29.4(VOUT) U29.5(VOUT) U30.8(VCC) U32.2(AVDD) U32.13(DVDD) U33.2(CSB) U33.6(VDDIO) U33.8(VDD) U34.4(VDD) U34.5(/SHDN)
VDDA: C26.2 C28.2 R5.2 R6.1 U1.H1(VDDA)
BLUE_BRTS: U1.J3(PA6) U3.16(GPIO24)
BLUE_LINK: R36.1 U1.K3(PA7) U3.6(GPIO07)
BLUE_RX: U1.J2(PA2) U3.8(GPIO05)
BLUE_TX: U1.K2(PA3) U3.9(GPIO06)
BUZZER: R27.1 U1.K8(PB12)
CHRG: R91.1 U11.7(CHRG#)
DPS_SCL: R128.2 R131.1 U1.K10(PD12) U32.1(SCL) U33.4(SCK)
DPS_SDA: R127.1 R132.2 U1.J10(PD13) U32.16(SDA) U33.3(SDI)
FMC_A16: FPC1.10 U1.G9(PD11)
FMC_D0: FPC1.17 U1.H8(PD14)
FMC_D1: FPC1.18 U1.G8(PD15)
FMC_D2: FPC1.19 U1.D8(PD0)
FMC_D3: FPC1.20 U1.E8(PD1)
FMC_D4: FPC1.21 U1.H5(PE7)
FMC_D5: FPC1.22 U1.J5(PE8)
FMC_D6: FPC1.23 U1.K5(PE9)
FMC_D7: FPC1.24 U1.G6(PE10)
FMC_D8: FPC1.25 U1.H6(PE11)
FMC_D9: FPC1.26 U1.J6(PE12)
FMC_D10: FPC1.27 U1.K6(PE13)
FMC_D11: FPC1.28 U1.G7(PE14)
FMC_D12: FPC1.29 U1.H7(PE15)
FMC_D13: FPC1.30 U1.K9(PD8)
FMC_D14: FPC1.31 U1.J9(PD9)
FMC_D15: FPC1.32 U1.H9(PD10)
FMC_NE1: FPC1.9 U1.D6(PD7)
FMC_NOE: FPC1.12 U1.D7(PD4)
FMC_NWE: FPC1.11 U1.B6(PD5)
GPS_ON: U1.A7(PB3) U30.5(ON/OFF)
GPS_RST: U1.A6(PB4) U30.9(NRESET)
GPS_RX: U1.B5(PB6) U30.3(RXD)
GPS_TX: U1.A5(PB7) U30.2(TXD)
IST_RST: U1.G5(PB2) U32.14(RSTN)
K: FPC1.34 FPC1.35 FPC1.36 R32.2
LIGHT: C97.2 R115.1 R116.1 U1.H2(PA1)
LIGHT_CL1: FPC3.4 U1.K4(PB1)
LIGHT_CL2: FPC3.5 U1.J4(PB0)
MPU_INT: R29.1 U1.B3(PE3)
MPU_SCL: R22.2 R24.1 U1.B4(PB8)
MPU_SDA: R21.2 R23.1 U1.A4(PB9)
OSC_IN: C23.1 U1.C1(PHO-OSC_IN) X3.1
OSC_OUT: C24.2 U1.D1(PH1-OSC_OUT) X3.3
PA0: FPC4.15 U1.G2(PA0)
PA4: FPC4.17 U1.G3(PA4)
PA5: C96.2 R113.2 R114.2 U1.H3(PA5)
PA9: R34.1 U1.C9(PA9)
PA10: FPC2.4 U1.D10(PA10)
PA11: FPC2.5 U1.C10(PA11)
PA13: R8.1 U1.A10(PA13) USB1.5(DN2) USB1.7(DN1)
PA14: R10.1 U1.A9(PA14) USB1.6(DP1) USB1.8(DP2)
PB5: FPC4.16 U1.C5(PB5)
PB10: U1.J7(PB10) U26.2(PA6/2_RX)
PB11: U1.K7(PB11) U26.3(PA5/2_TX)
PB15: FPC1.15 U1.G10(PB15)
PC1: FPC4.12 U1.F2(PC1)
PC2: FPC4.9 U1.E2(PC2_C)
PC3: FPC4.13 U1.F3(PC3_C)
PC4: FPC2.3 R31.1 U1.G4(PC4)
PC5: FPC2.2 R30.1 U1.H4(PC5)
PC6: U1.F10(PC6) USB2.6(DP1) USB2.8(DP2)
PC7: U1.E10(PC7) USB2.5(DN2) USB2.7(DN1)
PC8: CARD1.7(DAT0(D0)) R20.1 U1.F9(PC8)
PC9: CARD1.8(DAT1(RSV)) R19.1 U1.E9(PC9)
PC10: CARD1.1(DAT2(RSV)) R18.1 U1.B9(PC10)
PC11: CARD1.2(CDDAT3(CS)) R17.1 U1.B8(PC11)
PC12: CARD1.5(CLK(SCLK)) R38.1 U1.C8(PC12)
PC13: FPC4.7 U1.A2(PC13)
PD2: CARD1.3(CMD(DI)) R37.1 U1.B7(PD2)
PE0: FPC4.14 U1.D4(PE0)
PE1: FPC4.8 U1.C4(PE1)
PE2: FPC4.10 U1.A3(PE2)
PE6: FPC4.11 U1.E3(PE6)
REST: C20.2 R4.1 SW2.1 U1.E1(NRST)
SK_RX: U26.16(PB5) USB3.6(DP1) USB3.8(DP2)
SK_TX: U26.15(PB6) USB3.5(DN2) USB3.7(DN1)
SOC32_IN: C21.1 U1.A1(PC14-OSC32_IN) X2.2
SOC32_OUT: C22.2 U1.B1(PC15-OSC32_OUT) X2.1
STDBY: R92.1 U11.6(STDBY#)
VREF+: C25.2 C27.2 R5.1 U1.F4(VDDLDO)
$1N1733: R1.2 U1.D5(BOOT0)
$1N1745: C2.1 U1.F8(VCAP)
$1N1747: C1.2 U1.E7(VCAP)
$2N2417: Q1.1(B) R27.2 R28.2
$2N2422: C35.2 U4.10(REGOUT)
$2N2423: R29.2 U4.12(INT)
$2N2424: R25.1 U4.9(AD0)
$2N2433: C36.1 U4.20(CPOUT)
$2N2438: R21.1 U4.24(SDA)
$2N2439: R22.1 U4.23(SCL)
$2N2440: BUZZER1.2 Q1.3(C)
$2N2442: LED2.1(C) R36.2
$2N2451: Q2.3(C) R32.1
$2N2452: Q2.1(B) R33.1 R34.2 R35.2
$2N2980: D1.2(K) U30.6(VBAT) U31.1(+)
$2N11128: C109.2 U32.10(C1)
$2N11434: R129.1 U32.5(CAD0)
$2N11438: R130.2 U32.6(CAD1)
$2N13778: U30.11(RF_IN) U34.6(RFOUT)
$2N13942: L2.2 U34.3(RFIN)
$2N13944: C114.2 L2.1
$2N13946: C114.1 RF1.1(SIG)
$3N3396: R3.2 U11.2(PROG)
$3N3405: L1.1 U29.6(L2) U29.7(L2)
$3N3406: R124.1 R125.2 U29.3(FB)
$3N3408: L1.2 U29.8(L1) U29.9(L1)
$3N3410: C101.1 U29.1(VINA) U29.12(EN) U29.13(PS/SYNC)
$3N3413: R123.2 U29.14(PG)
$3N3889: R102.1 U24.1(OUT)
$3N3891: R101.2 R102.2 U23.1(B)
$3N3892: R100.1 R103.2 U23.3(C)
$3N3897: Q3.1(G) R103.1
$3N4167: LED3.1(C) R92.2
$3N4168: LED4.1(C) R91.2
$3N8088: SW4.2 U24.3(KEY)

Not connected (* = marked no-connect by the designer): CARD1 9(CD)*; FPC1 1* 2* 3* 4* 8* 14*; U1 A8(PA15)* B10(PA12)* C3(PE4)* C6(PD6)* C7(PD3)* D3(PE5)* D9(PA8)* F1(PC0)* H10(PB14)* J8(PB13)*; U3 1(GND)* 3(GPIO00/SWC)* 4(GPIO01/SWD)* 5(RESET)* 7(GPIO04)* 12(GPIO20)* 13(GPIO21)* 14(GPIO22)* 15(GPIO23)* 17(GPIO25)* 18(GPIO08)*; U4 2(NC)* 3(NC)* 4(NC)* 5(NC)* 6(AUX_DA)* 7(AUX_CL)* 14(NC)* 15(NC)* 16(NC)* 17(NC)* 19(RESV)* 21(RESV)* 22(RESV)* 25(EP)*; U24 4(NC)* 6(NC)*; U26 4(PA3)* 5(PA2)* 6(PA1)* 7(PA0)* 8(SPK-)* 9(SPK+)* 10(MIC-)* 11(MIC+)* 12(MUTE)* 13(PA4)* 14(PC4)* 17(5V)*; U30 4(1PPS)* 7(NC)* 13(NC)* 14(VCC_RF)* 15(Reserved)* 16(SDA)* 17(SCL)* 18(Reserved)*; U32 3(NC)* 4(NC)* 7(VPP)* 8(NC)* 12(NC)* 15(DRDY)*; USB1 3(SBU2)* 4(CC1)* 9(SBU1)* 10(CC2)*; USB2 3(SBU2)* 4(CC1)* 9(SBU1)* 10(CC2)*; USB3 3(SBU2)* 4(CC1)* 9(SBU1)* 10(CC2)*

## Notes on the sheets
sheet 1
- STM32H743VUH6最小系统
sheet 2
- SD卡
- 蓝牙
- MPU6050
- GPS
- 蜂鸣器
- 地磁计
- 气压计
- 扩展接口
- 握把接口
- 屏幕
sheet 3
- Type-C调试/电源接口
- 开/关机控制
- 电源切换
- 充电芯片
- 5V-3.3V
